# Altium project MD041A.PrjPcb (part 2 of 3)

## Sheet MD041_ezFET_RevA.SchDoc
size 431 x 279 mm; Date: Not shown in title block; ApprovedBy: Not shown in title block; CheckedBy: Not shown in title block; Author: Not shown in title block; CompanyName: Not shown in title block; Engineer: Not shown in title block; Organization: Not shown in title block; Address1: Not shown in title block; Address2: Not shown in title block; Address3: Not shown in title block; Address4: Not shown in title block; DocumentNumber: 2; Revision: Use project parameter SCH_Rev; SheetNumber: 2; SheetTotal: 4; PageSetup: Record=PageOptions|CenterHorizontal=True|CenterVertical=True|PrintScale=1.00|XCorrection=1.00|YCorrection=1.00|PrintKind=0|BorderSize=5000000|LeftOffset=0|BottomOffset=0|Orientation=2|PaperLength=1000|PaperWidth=1000|Scale=100|PaperSource=15|PrintQuality=600|MediaType=1|DitherType=10|PaperKind=Letter|PrintScaleMode=1; CurrentTime: Not shown in title block; CurrentDate: Not shown in title block; Time: Not shown in title block; DocumentFullPathAndName: Not shown in title block; DocumentName: Not shown in title block; ModifiedDate: Not shown in title block; ImagePath: Not shown in title block
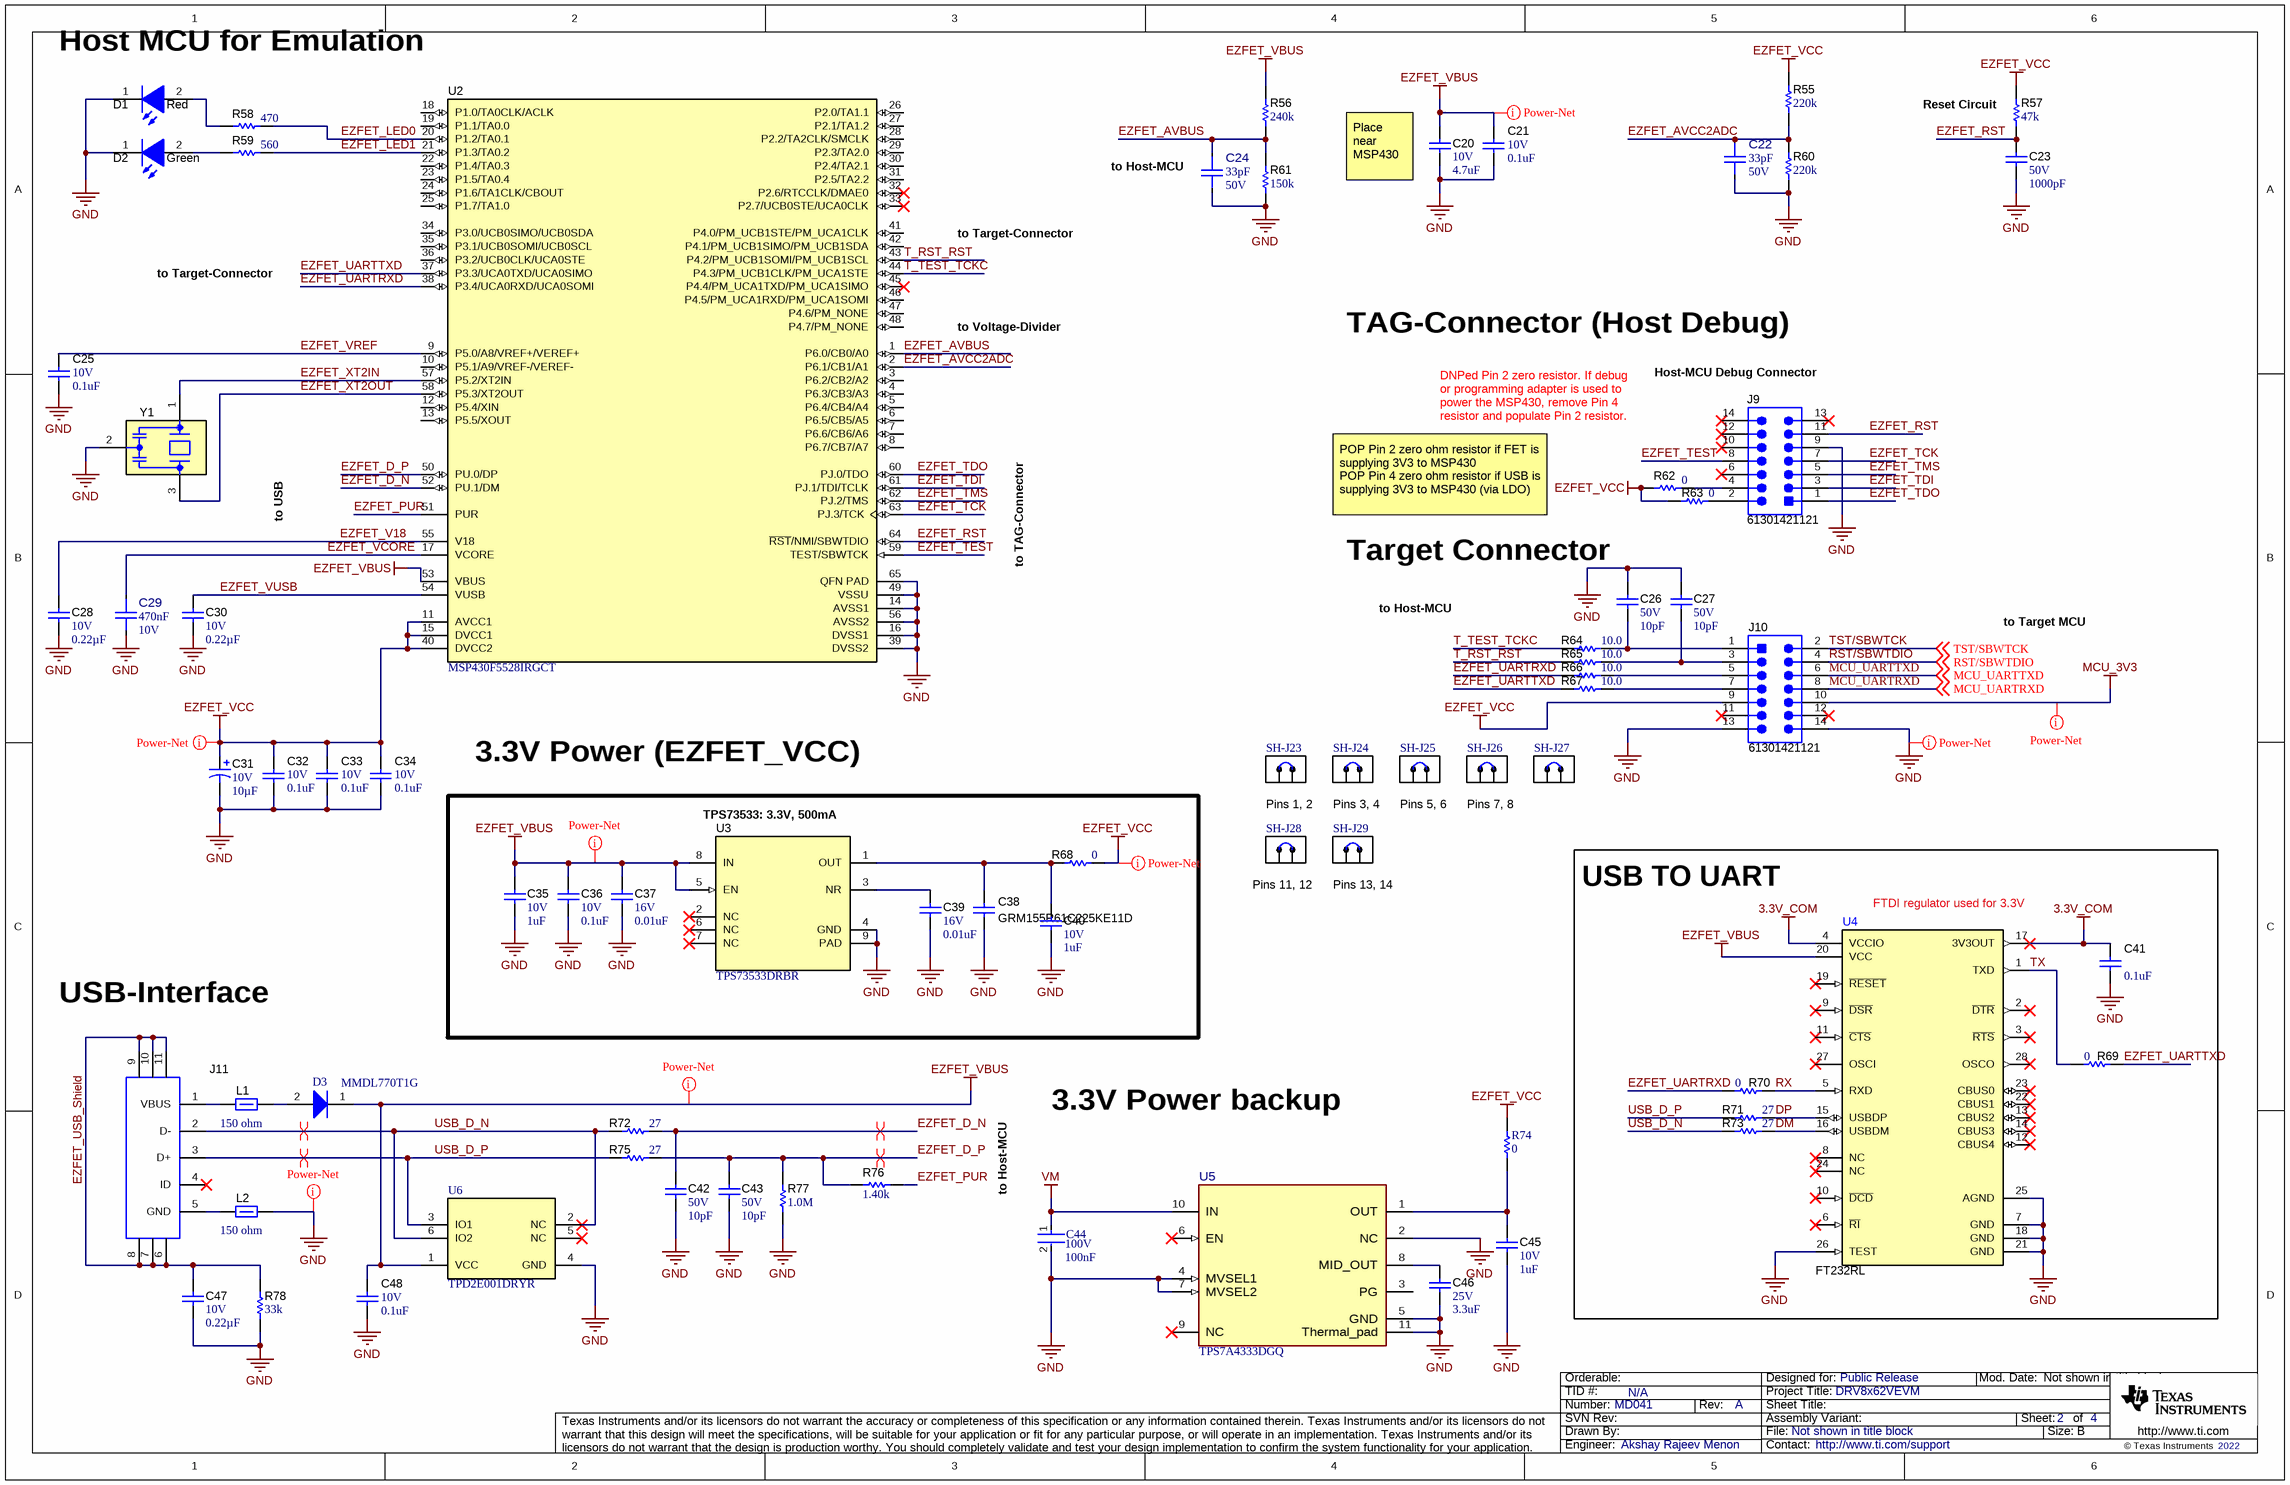
[diagram p1: MD041_ezFET_RevA.SchDoc]

### Parts
C20  VDC_V: 10V  ValueDisplayed: 4.7uF  [0402]  (hidden comment: C1005X5R1A475M050BC)
C21  VDC_V: 10V  ValueDisplayed: 0.1uF  [0402]  (hidden comment: 885012105010)
C22  ValueDisplayed: 33pF  VDC_V: 50V  [FP-885012005058_0402-MFG]  (hidden comment: 885012005058)
C23  VDC_V: 50V  ValueDisplayed: 1000pF  [0402]  (hidden comment: 885012205061)
C24  ValueDisplayed: 33pF  VDC_V: 50V  [FP-885012005058_0402-MFG]  (hidden comment: 885012005058)
C25  VDC_V: 10V  ValueDisplayed: 0.1uF  [0402]  (hidden comment: 885012105010)
C26  VDC_V: 50V  ValueDisplayed: 10pF  [0402]  (hidden comment: 885012005055)
C27  VDC_V: 50V  ValueDisplayed: 10pF  [0402]  (hidden comment: 885012005055)
C28  VDC_V: 10V  ValueDisplayed: 0.22µF  [0402]  (hidden comment: 885012105011)
C29  ValueDisplayed: 470nF  VDC_V: 10V  [FP-885012106008_0603-MFG]  (hidden comment: 885012106008)
C30  VDC_V: 10V  ValueDisplayed: 0.22µF  [0402]  (hidden comment: 885012105011)
C31  VDC_V: 10V  ValueDisplayed: 10µF  [3216-18]  (hidden comment: T520A106M010ATE080)
C32  VDC_V: 10V  ValueDisplayed: 0.1uF  [0402]  (hidden comment: 885012105010)
C33  VDC_V: 10V  ValueDisplayed: 0.1uF  [0402]  (hidden comment: 885012105010)
C34  VDC_V: 10V  ValueDisplayed: 0.1uF  [0402]  (hidden comment: 885012105010)
C35  VDC_V: 10V  ValueDisplayed: 1uF  [0402]  (hidden comment: 885012105012)
C36  VDC_V: 10V  ValueDisplayed: 0.1uF  [0402]  (hidden comment: GRM155R61A104KA01D)
C37  VDC_V: 16V  ValueDisplayed: 0.01uF  [0402]  (hidden comment: GRM155R71C103KA01D)
C38  GRM155R61C225KE11D  [0402]
C39  VDC_V: 16V  ValueDisplayed: 0.01uF  [0402]  (hidden comment: GRM155R71C103KA01D)
C40  VDC_V: 10V  ValueDisplayed: 1uF  [0402]  (hidden comment: 885012105012)
C41  ValueDisplayed: 0.1uF  [0402]  (hidden comment: 885012105010)
C42  VDC_V: 50V  ValueDisplayed: 10pF  [0402]  (hidden comment: 885012005055)
C43  VDC_V: 50V  ValueDisplayed: 10pF  [0402]  (hidden comment: 885012005055)
C44  Voltage Rating: 100V  Capacitance: 100nF  [FP-0603-L_1_6_0_1-W_0_8_0-IPC_B]  (hidden comment: HMK107BJ104MA-T)
C45  VDC_V: 10V  ValueDisplayed: 1uF  [0402]  (hidden comment: 885012105012)
C46  VDC_V: 25V  ValueDisplayed: 3.3uF  [0805_HV]  (hidden comment: GRM21BC81E335KA73L)
C47  VDC_V: 10V  ValueDisplayed: 0.22µF  [0402]  (hidden comment: 885012105011)
C48  VDC_V: 10V  ValueDisplayed: 0.1uF  [0402]  (hidden comment: 885012105010)
D1  value Red  [WL-SMCW_RED]  (hidden comment: 150060RS75000)
D2  value Green  [WL-SMCW_GREEN]  (hidden comment: 150060VS75000)
D3  MMDL770T1G  [ONSC-SOD-323-2-477-02_V]
J9  61301421121  [Wurth_61301421121]
J10  61301421121  [Wurth_61301421121]
J11  1051640001  [Molex_1051640001]  (value not drawn)
L1  value 150 ohm  [0603]  (hidden comment: BLM18AG151BH1D)
L2  ValueDisplayed: 150 ohm  [0603]  (hidden comment: BLM18AG151BH1D)
R55  ValueDisplayed: 220k  [0402]  (hidden comment: RC0402FR-07220KL)
R56  ValueDisplayed: 240k  [0402]  (hidden comment: CRCW0402240KFKED)
R57  ValueDisplayed: 47k  [0402]  (hidden comment: CRCW040247K0JNED)
R58  ValueDisplayed: 470  [0402]  (hidden comment: CRCW0402470RJNED)
R59  ValueDisplayed: 560  [0402]  (hidden comment: CRCW0402560RJNED)
R60  ValueDisplayed: 220k  [0402]  (hidden comment: RC0402FR-07220KL)
R61  ValueDisplayed: 150k  [0402]  (hidden comment: CRCW0402150KFKED)
R62  value 0  [0402L]  (hidden comment: ERJ-2GE0R00X)
R63  value 0  [0402L]  (hidden comment: ERJ-2GE0R00X)
R64  ValueDisplayed: 10.0  [0402]  (hidden comment: CRCW040210R0FKED)
R65  ValueDisplayed: 10.0  [0402]  (hidden comment: CRCW040210R0FKED)
R66  ValueDisplayed: 10.0  [0402]  (hidden comment: CRCW040210R0FKED)
R67  ValueDisplayed: 10.0  [0402]  (hidden comment: CRCW040210R0FKED)
R68  value 0  [0402L]  (hidden comment: Resistor)
R69  value 0  [0603L]  (hidden comment: Resistor)
R70  value 0  [0603L]  (hidden comment: Resistor)
R71  ValueDisplayed: 27  [0402]  (hidden comment: CRCW040227R0JNED)
R72  ValueDisplayed: 27  [0402]  (hidden comment: CRCW040227R0JNED)
R73  ValueDisplayed: 27  [0402]  (hidden comment: CRCW040227R0JNED)
R74  0  [RESC1005X40X25NL05T05]
R75  ValueDisplayed: 27  [0402]  (hidden comment: CRCW040227R0JNED)
R76  ValueDisplayed: 1.40k  [0402]  (hidden comment: CRCW04021K40FKED)
R77  ValueDisplayed: 1.0M  [0402]  (hidden comment: CRCW04021M00JNED)
R78  ValueDisplayed: 33k  [0402]  (hidden comment: CRCW040233K0JNED)
SH-J23  60900213421  [Wurth_60900213421]  (value not drawn)
SH-J24  60900213421  [Wurth_60900213421]  (value not drawn)
SH-J25  60900213421  [Wurth_60900213421]  (value not drawn)
SH-J26  60900213421  [Wurth_60900213421]  (value not drawn)
SH-J27  60900213421  [Wurth_60900213421]  (value not drawn)
SH-J28  60900213421  [Wurth_60900213421]  (value not drawn)
SH-J29  60900213421  [Wurth_60900213421]  (value not drawn)
U2  MSP430F5528IRGCT  [RGC0064B]
U3  TPS73533DRBR  [DRB0008A]
U4  FT232RL  [SSOP28_N]
U5  TPS7A4333DGQ  [DGQ0010E-MFG]
U6  TPD2E001DRYR  [DRY0006A]
Y1  CSTNR4M00GH5L000R0  [MuRata_CSTNR]  (value not drawn)

### Blocks framed on the sheet
TPS73533: 3.3V, 500mA: C35-C40 R68 U3
USB TO UART: C41 R69-R71 R73 U4

### Nets
3.3V_COM: C41.1 U4.4(VCCIO) U4.17(3V3OUT)
EZFET_VBUS: C20.1 C21.1 C35.1 C36.1 C37.1 C48.1 D3.1(K) R56.2 U2.53(VBUS) U3.5(EN) U3.8(IN) U4.20(VCC) U6.1(VCC)
EZFET_VCC: C31.1(+) C32.1 C33.1 C34.1 J10.9 R55.2 R57.2 R62.1 R63.1 R68.2 R74.2 U2.11(AVCC1) U2.15(DVCC1) U2.40(DVCC2)
GND: C20.2 C21.2 C22.2 C23.2 C24.2 C25.2 C26.1 C27.1 C28.2 C29.2 C30.2 C31.2(-) C32.2 C33.2 C34.2 C35.2 C36.2 C37.2 C38.2 C39.2 C40.2 C41.2 C42.2 C43.2 C44.2 C45.2 C46.2 C47.2 C48.2 D1.1(K) D2.1(K) J9.9 J10.13 J10.14 L2.2 R60.1 R61.1 R77.1 R78.1 U2.14(AVSS1) U2.16(DVSS1) U2.39(DVSS2) U2.49(VSSU) U2.56(AVSS2) U2.65(QFN_PAD) U3.4(GND) U3.9(PAD) U4.7(GND) U4.18(GND) U4.21(GND) U4.25(AGND) U4.26(TEST) U5.2(NC) U5.4(MVSEL1) U5.5(GND) U5.7(MVSEL2) U5.11(Thermal_pad) U6.4(GND) Y1.2(GND)
MCU_3V3: J10.10
VM: C44.1 U5.10(IN)
DM: R73.2 U4.16(USBDM)
DP: R71.2 U4.15(USBDP)
EZFET_AVBUS: C24.1 R56.1 R61.2 U2.1(P6.0/CB0/A0)
EZFET_AVCC2ADC: C22.1 R55.1 R60.2 U2.2(P6.1/CB1/A1)
EZFET_D_N: C42.1 R72.2 U2.52(PU.1/DM)
EZFET_D_P: C43.1 R75.2 R76.1 R77.2 U2.50(PU.0/DP)
EZFET_LED0: R58.2 U2.20(P1.2/TA0.1)
EZFET_LED1: R59.2 U2.21(P1.3/TA0.2)
EZFET_PUR: R76.2 U2.51(PUR)
EZFET_RST: C23.1 J9.11 R57.1 U2.64(~{RST}/NMI/SBWTDIO)
EZFET_TCK: J9.7 U2.63(PJ.3/TCK)
EZFET_TDI: J9.3 U2.61(PJ.1/TDI/TCLK)
EZFET_TDO: J9.1 U2.60(PJ.0/TDO)
EZFET_TEST: J9.8 U2.59(TEST/SBWTCK)
EZFET_TMS: J9.5 U2.62(PJ.2/TMS)
EZFET_UARTRXD: R66.1 R70.2 U2.38(P3.4/UCA0RXD/UCA0SOMI)
EZFET_UARTTXD: R67.1 R69.1 U2.37(P3.3/UCA0TXD/UCA0SIMO)
EZFET_USB_Shield: C47.1 J11.6 J11.7 J11.8 J11.9 J11.10 J11.11 R78.2
EZFET_V18: C28.1 U2.55(V18)
EZFET_VCORE: C29.1 U2.17(VCORE)
EZFET_VREF: C25.1 U2.9(P5.0/A8/VREF+/VEREF+)
EZFET_VUSB: C30.1 U2.54(VUSB)
EZFET_XT2IN: U2.57(P5.2/XT2IN) Y1.1(In)
EZFET_XT2OUT: U2.58(P5.3/XT2OUT) Y1.3(Out)
MCU_UARTRXD: J10.8 ; off-sheet MCU_UARTRXD
MCU_UARTTXD: J10.6 ; off-sheet MCU_UARTTXD
RST/SBWTDIO: J10.4 ; off-sheet RST/SBWTDIO
RX: R70.1 U4.5(RXD)
T_RST_RST: R65.1 U2.43(P4.2/PM_UCB1SOMI/PM_UCB1SCL)
T_TEST_TCKC: R64.1 U2.44(P4.3/PM_UCB1CLK/PM_UCA1STE)
TST/SBWTCK: J10.2 ; off-sheet TST/SBWTCK
TX: R69.2 U4.1(TXD)
USB_D_N: J11.2(D-) R72.1 R73.1 U6.2(NC) U6.6(IO2)
USB_D_P: J11.3(D+) R71.1 R75.1 U6.3(IO1)
NetC26_2: C26.2 J10.1 R64.2
NetC27_2: C27.2 J10.3 R65.2
NetC38_1: C38.1 C40.1 R68.1 U3.1(OUT)
NetC39_1: C39.1 U3.3(NR)
NetC45_1: C45.1 R74.1 U5.1(OUT)
NetC46_1: C46.1 U5.8(MID_OUT)
NetD1_2: D1.2(A) R58.1
NetD2_2: D2.2(A) R59.1
NetD3_2: D3.2(A) L1.2
NetJ9_2: J9.2 R63.2
NetJ9_4: J9.4 R62.2
NetJ10_5: J10.5 R66.2
NetJ10_7: J10.7 R67.2
NetJ11_1: J11.1(VBUS) L1.1
NetJ11_5: J11.5(GND) L2.1

Not connected (* = marked no-connect by the designer): J9 6* 10* 12* 13* 14*; J10 11* 12*; J11 4(ID)*; U2 3(P6.2/CB2/A2) 4(P6.3/CB3/A3) 5(P6.4/CB4/A4) 6(P6.5/CB5/A5) 7(P6.6/CB6/A6) 8(P6.7/CB7/A7) 10(P5.1/A9/VREF-/VEREF-) 12(P5.4/XIN) 13(P5.5/XOUT) 18(P1.0/TA0CLK/ACLK) 19(P1.1/TA0.0) 22(P1.4/TA0.3) 23(P1.5/TA0.4) 24(P1.6/TA1CLK/CBOUT) 25(P1.7/TA1.0) 26(P2.0/TA1.1) 27(P2.1/TA1.2) 28(P2.2/TA2CLK/SMCLK) 29(P2.3/TA2.0) 30(P2.4/TA2.1) 31(P2.5/TA2.2) 32(P2.6/RTCCLK/DMAE0)* 33(P2.7/UCB0STE/UCA0CLK)* 34(P3.0/UCB0SIMO/UCB0SDA) 35(P3.1/UCB0SOMI/UCB0SCL) 36(P3.2/UCB0CLK/UCA0STE) 41(P4.0/PM_UCB1STE/PM_UCA1CLK) 42(P4.1/PM_UCB1SIMO/PM_UCB1SDA) 45(P4.4/PM_UCA1TXD/PM_UCA1SIMO)* 46(P4.5/PM_UCA1RXD/PM_UCA1SOMI) 47(P4.6/PM_NONE) 48(P4.7/PM_NONE); U3 2(NC)* 6(NC)* 7(NC)*; U4 2(~{DTR})* 3(~{RTS})* 6(~{RI})* 8(NC)* 9(~{DSR})* 10(~{DCD})* 11(~{CTS})* 12(CBUS4)* 13(CBUS2)* 14(CBUS3)* 19(~{RESET})* 22(CBUS1)* 23(CBUS0)* 24(NC)* 27(OSCI)* 28(OSCO)*; U5 3(PG) 6(EN)* 9(NC)*; U6 5(NC)*

### Layout directives
net class Power-Net: EZFET_VBUS, EZFET_VCC, GND, MCU_3V3
differential pair: EZFET_D_N, EZFET_D_P, USB_D_N, USB_D_P

### Notes on the sheet
- (near D1) Host MCU for Emulation
- (near C24) to Host-MCU
- (near R57) Reset Circuit
- to Target-Connector
- (near C20) Place near MSP430
- to Voltage-Divider
- TAG-Connector (Host Debug)
- DNPed Pin 2 zero resistor. If debug or programming adapter is used to power the MSP430, remove Pin 4 resistor and populate Pin 2 resistor.
- (near J9) Host-MCU Debug Connector
- to USB
- to TAG-Connector
- POP Pin 2 zero ohm resistor if FET is supplying 3V3 to MSP430
  POP Pin 4 zero ohm resistor if USB is supplying 3V3 to MSP430 (via LDO)
- Target Connector
- to Host-MCU
- to Target MCU
- 3.3V Power (EZFET_VCC)
- Pins 1, 2
- Pins 3, 4
- (near SH-J25) Pins 5, 6
- (near SH-J26) Pins 7, 8
- (near SH-J28) Pins 11, 12
- (near SH-J29) Pins 13, 14
- (near U4) FTDI regulator used for 3.3V
- USB-Interface
- 3.3V Power backup
- Drawn By:
- SVN Rev:
- Number:
- TID #:
- Orderable:
- Rev:
- Sheet Title:
- File:
- Project Title:
- Designed for:
- Assembly Variant:
- Mod. Date:
- Sheet:
- Size:
- of
- B
- http://www.ti.com
- Texas Instruments and/or its licensors do not warrant the accuracy or completeness of this specification or any information contained therein. Texas Instruments and/or its licensors do not warrant that this design will meet the specifications, will be suitable for your application or fit for any particular purpose, or will operate in an implementation. Texas Instruments and/or its licensors do not warrant that the design is production worthy. You should completely validate and test your design implementation to confirm the system functionality for your application.
- Engineer:
- Contact:
- © Texas Instruments

### Library data of the parts
C20 = CMP-0006269-2: CAP, CERM, 4.7 uF, 10 V, +/- 20%, X5R, 0402; Manufacturer: TDK; TaMin_C: -55°C; Polarized: N; SizeAreaWB_mm2: 3; Value1: Unknown; U/M: EA; Value: 4.7uF; TaMax_C: 85°C; SizeZ_mm: 0.6; SizeX_mm: 1; SizeY_mm: 0.5; Cap_F: 4.7µF; AEC Category: Q200; ComponentLink1URL: http://product.tdk.com/en/catalog/datasheets/mlcc_commercial_general_en.pdf; Supplier Part Number 2: 04X3214; Publisher: Texas Instruments; Supplier 2: Newark; Supplier Part Number 3: 810-C1005X5R1A475M; TempCo: X5R; Supplier 3: Mouser; Published: 2008-06-19; RoHS: Y; MountType: SMT; Supplier 1: Digi-Key; PackageReference: 0402; Tolerance_%: 20%; Cap_Case: 0402; Value2: 10V; SizeArea_mm2: 0.5; CompType: Capacitor; LatestRevisionDate: 2017-03-09; PartNumber: C1005X5R1A475M050BC; AEC Qualified: N; ComponentLink1Description: Datasheet link; AEC Grade: N/A; Supplier Part Number 1: 445-8023-1-ND; Technology: Ceramic
C21 C25 C32-C34 C48 = CMP-0006221-2: CAP, CERM, 0.1 uF, 10 V, +/- 20%, X5R, 0402; Manufacturer: Wurth Elektronik; TaMin_C: -55°C; Polarized: N; SizeAreaWB_mm2: 3; Value1: Unknown; U/M: EA; Value: 0.1uF; TaMax_C: 85°C; SizeZ_mm: 0.6; SizeX_mm: 1; SizeY_mm: 0.5; Cap_F: 100nF; AEC Category: Q200; Supplier Part Number 2: 710-885012105010; Publisher: Texas Instruments; Supplier 2: Mouser; TempCo: X5R; Published: 2008-06-19; RoHS: Y; MountType: SMT; Supplier 1: Digi-Key; PackageReference: 0402; Tolerance_%: 20%; Cap_Case: 0402; Value2: 10V; SizeArea_mm2: 0.5; CompType: Capacitor; LatestRevisionDate: 2017-03-09; PartNumber: 885012105010; AEC Qualified: N; ComponentLink1Description: Datasheet link; AEC Grade: N/A; Supplier Part Number 1: 732-7487-1-ND; Technology: Ceramic; ComponentLink1URL: http://katalog.we-online.de/pbs/datasheet/885012105010.pdf
C22 C24 = CMP-0097306-1: 33 pF ±5% 50V Ceramic Capacitor C0G, NP0 0402 (1005 Metric); Manufacturer: Wurth Electronics; AEC Qualified: No; Value: 33pF; TempCo: 30ppm/°C; SizeZ_mm: 0.55mm; Temperature Characteristic: NP0; Datasheet Path: datasheets/Cap-885012005058.pdf; Supplier 2: Mouser; Tolerance_%: 5%; Operating Temperature Range: -55°C to +125°C; PackageReference: 0402; Part Number: 885012005058; Digikey Part Number: 732-7472-1-ND; Cap_F: 33pF; Mouser Part Number: 710-885012005058; Supplier Part Number 1: 732-7472-1-ND; Lead Free: Yes; datasheet: https://www.we-online.com/catalog/datasheet/885012005058.pdf; helpURL: https://upverter.com/upn/revision/4d12e9af320262d8/; ComponentLink1Description: Datasheet; Supplier 1: Digikey; ComponentLink1URL: https://www.we-online.com/catalog/datasheet/885012005058.pdf; Supplier Part Number 2: 710-885012005058; RoHS: TRUE; PartNumber: 885012005058; Digikey Description: CAP CER 33PF 50V C0G/NP0 0402
C23 = CMP-0006231-2: CAP, CERM, 1000 pF, 50 V, +/- 10%, X7R, 0402; Manufacturer: Wurth Elektronik; TaMin_C: -55°C; Polarized: N; SizeAreaWB_mm2: 3; Value1: Unknown; U/M: EA; Value: 1000pF; TaMax_C: 125°C; SizeZ_mm: 0.6; SizeX_mm: 1; SizeY_mm: 0.5; Cap_F: 1nF; AEC Category: Q200; Supplier Part Number 2: 710-885012205061; Publisher: Texas Instruments; Supplier 2: Mouser; TempCo: X7R; Published: 2008-06-19; RoHS: Y; MountType: SMT; Supplier 1: Digi-Key; PackageReference: 0402; Tolerance_%: 10%; Cap_Case: 0402; Value2: 50V; SizeArea_mm2: 0.5; CompType: Capacitor; LatestRevisionDate: 2017-03-09; PartNumber: 885012205061; AEC Qualified: N; ComponentLink1Description: Datasheet link; AEC Grade: N/A; Supplier Part Number 1: 732-7556-1-ND; Technology: Ceramic; ComponentLink1URL: http://katalog.we-online.de/pbs/datasheet/885012205061.pdf
C26 C27 C42 C43 = CMP-0006215-2: CAP, CERM, 10 pF, 50 V, +/- 5%, C0G/NP0, 0402; Manufacturer: Wurth Elektronik; TaMin_C: -55°C; Polarized: N; SizeAreaWB_mm2: 3; Value1: Unknown; U/M: EA; Value: 10pF; TaMax_C: 125°C; SizeZ_mm: 0.6; SizeX_mm: 1; SizeY_mm: 0.5; AEC Category: Q200; Supplier Part Number 2: 710-885012005055; Publisher: Texas Instruments; Supplier 2: Mouser; TempCo: C0G/NP0; Published: 2008-06-19; RoHS: Y; MountType: SMT; Supplier 1: Digi-Key; PackageReference: 0402; Tolerance_%: 5%; Cap_Case: 0402; Value2: 50V; SizeArea_mm2: 0.5; CompType: Capacitor; LatestRevisionDate: 2017-03-09; PartNumber: 885012005055; AEC Qualified: N; Cap_F: 10pF; ComponentLink1Description: Datasheet link; AEC Grade: N/A; Supplier Part Number 1: 732-7469-1-ND; Technology: Ceramic; ComponentLink1URL: http://katalog.we-online.de/pbs/datasheet/885012005055.pdf
C28 C30 C47 = CMP-0078875-1: CAP, CERM, 0.22 µF, 10 V,+/- 20%, X5R, 0402; Manufacturer: Wurth Elektronik; TaMin_C: -55°C; Polarized: N; SizeAreaWB_mm2: 3; U/M: EA; Value: 0.22uF; TaMax_C: 85°C; SizeZ_mm: 0.6; SizeX_mm: 1; SizeY_mm: 0.5; Cap_F: 220nF; AEC Category: Q200; ComponentLink1URL: http://katalog.we-online.de/pbs/datasheet/885012105011.pdf; Supplier Part Number 2: 710-885012105011; Supplier 2: Mouser; TempCo: X5R; RoHS: Y; MountType: SMT; Supplier 1: Digi-Key; PackageReference: 0402; Tolerance_%: 20%; Cap_Case: 0402; Value2: 10V; SizeArea_mm2: 0.5; CompType: Capacitor; PartNumber: 885012105011; AEC Qualified: N; ComponentLink1Description: Datasheet link; AEC Grade: N/A; Supplier Part Number 1: 732-7488-1-ND; Technology: Ceramic
C29 = CMP-0097299-1: 0.47 µF ±20% 10V Ceramic Capacitor X5R 0603 (1608 Metric); Manufacturer: Wurth Electronics; Value: 470nF; AEC Qualified: No; TempCo: 15%; SizeZ_mm: 0.87mm; RoHS: TRUE; Mouser Description: Cap, Mlcc, X5r, 0.47Uf, 10V, 0603; Tolerance_%: 20%; Part Number: 885012106008; Supplier 1: Digikey; Lead Free: Yes; datasheet: https://www.we-online.com/catalog/datasheet/885012106008.pdf; Supplier 2: Mouser; ComponentLink1Description: Datasheet; ComponentLink1URL: https://www.we-online.com/catalog/datasheet/885012106008.pdf; Supplier Part Number 1: 732-7905-1-ND; PartNumber: 885012106008; Cap_F: 470nF; Operating Temperature Range: -55°C to +85°C; Temperature Characteristic: X5R; PackageReference: 0603; Digikey Part Number: 732-7905-1-ND; Digikey Description: CAP CER 0.47UF 10V X5R 0603; Mouser Part Number: 710-885012106008; Datasheet Path: datasheets/Cap-885012106008.pdf; helpURL: https://upverter.com/upn/revision/0b4a8a67df2e586c/; Supplier Part Number 2: 710-885012106008
C31 = CMP-0084376-1: CAP, Tantalum Polymer, 10 µF, 10 V,+/- 20%, 0.08 ohm, 3216-18 SMD; Manufacturer: Kemet; TaMin_C: -55°C; SizeArea_mm2: 5.12; Value: 10uF; SizeAreaWB_mm2: 10.92; SizeY_mm: 1.6; Polarized: Y; SizeX_mm: 3.2; AEC Qualified: N; TaMax_C: 105°C; SizeZ_mm: 1.8; ESR_ohm: 80m; CompType: Capacitor; AEC Category: Q200; PackageReference: 3216-18; Technology: Tantalum Polymer; Cap_Case: 3216-18; ComponentLink1URL: https://content.kemet.com/datasheets/KEM_T2076_T52X-530.pdf; ComponentLink1Description: Datasheet link; PartNumber: T520A106M010ATE080; Value1: 0.08 ohm; MountType: SMT; Value2: 10V; Cap_F: 10µF; RoHS: Y; Series: T520; Tolerance_%: 20%; AEC Grade: N/A
C35 C40 C45 = CMP-0064924-2: CAP, CERM, 1 uF, 10 V,+/- 20%, X5R, 0402; Manufacturer: Wurth Elektronik; TaMin_C: -55°C; Polarized: N; SizeAreaWB_mm2: 3; Value1: Unknown; U/M: EA; Value: 1uF; TaMax_C: 85°C; SizeZ_mm: 0.6; SizeX_mm: 1; SizeY_mm: 0.5; Cap_F: 1µF; AEC Category: Q200; ComponentLink1URL: http://katalog.we-online.de/pbs/datasheet/885012105012.pdf; Supplier Part Number 2: 75Y5997; Publisher: Texas Instruments; Supplier 2: Newark; Supplier Part Number 3: 710-885012105012; TempCo: X5R; Supplier 3: Mouser; Published: 2008-06-19; RoHS: Y; MountType: SMT; Supplier 1: Digi-Key; PackageReference: 0402; Tolerance_%: 20%; Cap_Case: 0402; Value2: 10V; SizeArea_mm2: 0.5; CompType: Capacitor; LatestRevisionDate: 2017-06-05; PartNumber: 885012105012; AEC Qualified: N; ComponentLink1Description: Datasheet link; AEC Grade: N/A; Supplier Part Number 1: 732-7489-1-ND; Technology: Ceramic
C36 = CMP-0006562-2: CAP, CERM, 0.1 uF, 10 V, +/- 10%, X5R, 0402; Manufacturer: MuRata; TaMin_C: -55°C; Polarized: N; SizeAreaWB_mm2: 3; Value1: Unknown; U/M: EA; Value: 0.1uF; TaMax_C: 85°C; SizeZ_mm: 0.6; SizeX_mm: 1; SizeY_mm: 0.5; Cap_F: 100nF; AEC Category: Q200; ComponentLink1URL: http://search.murata.co.jp/Ceramy/PnsearchViewAction.do?HnOFG=ON&HnNFG=ON&SEL_CNT=50&sLang=en&sKey=GRM155R61A104KA01D&x=9&y=9&search=startwith; Supplier Part Number 2: 81-GRM155R61A104KA01; Publisher: Texas Instruments; Supplier 2: Mouser; Supplier Part Number 3: 1828862; TempCo: X5R; Supplier 3: Farnell; Published: 2008-06-19; RoHS: Y; MountType: SMT; Supplier 1: Digi-Key; PackageReference: 0402; Tolerance_%: 10%; Cap_Case: 0402; Value2: 10V; SizeArea_mm2: 0.5; CompType: Capacitor; LatestRevisionDate: 2017-03-09; PartNumber: GRM155R61A104KA01D; AEC Qualified: ?; ComponentLink1Description: Datasheet link; Supplier Part Number 1: 490-1318-1-ND; Technology: Ceramic
C37 C39 = CMP-0006639-2: CAP, CERM, 0.01 uF, 16 V, +/- 10%, X7R, 0402; Manufacturer: MuRata; TaMin_C: -55°C; Polarized: N; SizeAreaWB_mm2: 3; Value1: Unknown; U/M: EA; Value: 0.01uF; TaMax_C: 125°C; SizeZ_mm: 0.6; SizeX_mm: 1; SizeY_mm: 0.5; Cap_F: 10nF; AEC Category: Q200; ComponentLink1URL: http://search.murata.co.jp/Ceramy/PnsearchViewAction.do?HnOFG=ON&HnNFG=ON&SEL_CNT=50&sLang=en&sKey=GRM155R71C103KA01D&x=9&y=9&search=startwith; Supplier Part Number 2: 14T3279; Publisher: Texas Instruments; Supplier 2: Newark; Supplier Part Number 3: 81-GRM36X103K16; TempCo: X7R; Supplier 3: Mouser; Published: 2008-06-19; RoHS: Y; MountType: SMT; Supplier 1: Digi-Key; PackageReference: 0402; Tolerance_%: 10%; Cap_Case: 0402; Value2: 16V; SizeArea_mm2: 0.5; CompType: Capacitor; LatestRevisionDate: 2017-03-09; PartNumber: GRM155R71C103KA01D; AEC Qualified: ?; ComponentLink1Description: Datasheet link; Supplier Part Number 1: 490-1313-1-ND; Technology: Ceramic
C38 = CMP-0006594-2: CAP, CERM, 2.2 uF, 16 V, +/- 10%, X5R, 0402; Manufacturer: MuRata; TaMin_C: -55°C; Polarized: N; SizeAreaWB_mm2: 3; Value1: Unknown; U/M: EA; Value: 2.2uF; TaMax_C: 85°C; SizeZ_mm: 0.6; SizeX_mm: 1; SizeY_mm: 0.5; Value2: 16V; Cap_F: 2.2µF; AEC Category: Q200; Supplier Part Number 2: 81-GRM155R61C225KE1D; Publisher: Texas Instruments; Supplier 2: Mouser; TempCo: X5R; Published: 2008-06-19; RoHS: Y; MountType: SMT; Supplier 1: Digi-Key; PackageReference: 0402; Tolerance_%: 10%; Cap_Case: 0402; SizeArea_mm2: 0.5; CompType: Capacitor; LatestRevisionDate: 2017-03-09; PartNumber: GRM155R61C225KE11D; AEC Qualified: N; VDC_V: 16V; ComponentLink1Description: Datasheet link; AEC Grade: N/A; Supplier Part Number 1: 490-10695-1-ND; Technology: Ceramic; ValueDisplayed: 2.2uF; ComponentLink1URL: http://psearch.en.murata.com/capacitor/product/GRM155R61C225KE11%23.pdf
C41 = CMP-0006221-2: CAP, CERM, 0.1 uF, 10 V, +/- 20%, X5R, 0402; Manufacturer: Wurth Elektronik; Value: 0.1uF; Polarized: N; U/M: EA; Cap_F: 100nF; Value1: Unknown; VDC_V: 10V; TaMin_C: -55°C; TaMax_C: 85°C; AEC Category: Q200; SizeArea_mm2: 0.5; SizeAreaWB_mm2: 3; SizeX_mm: 1; SizeZ_mm: 0.6; CompType: Capacitor; PartNumber: 885012105010; PackageReference: 0402; RoHS: Y; Tolerance_%: 20%; Value2: 10V; MountType: SMT; Technology: Ceramic; TempCo: X5R; Cap_Case: 0402; Published: 2008-06-19; Publisher: Texas Instruments; LatestRevisionDate: 2017-03-09; ComponentLink1Description: Datasheet link; ComponentLink1URL: http://katalog.we-online.de/pbs/datasheet/885012105010.pdf; Supplier 1: Digi-Key; Supplier Part Number 1: 732-7487-1-ND; Supplier 2: Mouser; Supplier Part Number 2: 710-885012105010; AEC Grade: N/A; AEC Qualified: N; SizeY_mm: 0.5
C44 = CMP-14477-003474-2: None; Dielectric: X5R; Tolerance: 20%; Mount: Surface Mount; Radiation Hardening: No; Max Operating Temperature: 85°C; RoHS Compliant: Yes; Depth: 0.8mm; Halogen Free: Halogen Free; Case/Package: Ceramic; Thickness: 0.035inch; Width: 0.031inch; Lead Free: Lead Free; Packaging: Tape and Reel; Min Operating Temperature: -55°C; Voltage Rating (DC): 100V; Length: 1.6mm
C46 = CMP-0008271-1: CAP, CERM, 3.3 uF, 25 V, +/- 10%, X6S, 0805; Manufacturer: MuRata; TaMin_C: -55°C; Polarized: N; SizeAreaWB_mm2: 6.75; Value1: Unknown; U/M: EA; Value: 3.3uF; TaMax_C: 105°C; SizeZ_mm: 1.45; SizeX_mm: 2; SizeY_mm: 1.25; Cap_Case: 0805; SizeArea_mm2: 2.5; Cap_F: 3.3µF; AEC Category: Q200; ComponentLink1URL: http://search.murata.co.jp/Ceramy/PnsearchViewAction.do?HnOFG=ON&HnNFG=ON&SEL_CNT=50&sLang=en&sKey=GRM21BC81E335KA73L&x=9&y=9&search=startwith; Supplier Part Number 2: 81-GRM21BC81E335KA3L; Publisher: Texas Instruments; Supplier 2: Mouser; TempCo: X6S; Published: 2008-06-19; RoHS: Y; MountType: SMT; Supplier 1: Digi-Key; PackageReference: 0805; Tolerance_%: 10%; Value2: 25V; CompType: Capacitor; LatestRevisionDate: 2017-03-09; PartNumber: GRM21BC81E335KA73L; AEC Qualified: ?; ComponentLink1Description: Datasheet link; Supplier Part Number 1: GRM21BC81E335KA73L-ND; Technology: Ceramic
D1 = CMP-0002947-3: LED, Red, SMD; Manufacturer: Wurth Elektronik; Type: AlInGaP; Vf_V: 2V; Io_A: 30mA; Vr_V: 5V; Tjmax_C: 85°C; Power_TotalModule: 72mW; Value1: 0.072W; Angle: 140; CompType: LED; PartNumber: 150060RS75000; MountType: SMT; RoHS: Y; PackageReference: LED_0603; Value2: 2V; Color: Red; ComponentLink1URL: http://katalog.we-online.de/led/datasheet/150060RS75000.pdf; ComponentLink1Description: Datasheet link
D2 = CMP-0002894-2: LED, Green, SMD; Manufacturer: Wurth Elektronik; Type: AlInGaP; Vf_V: 2V; Io_A: 20mA; Value1: W; CompType: LED; PartNumber: 150060VS75000; MountType: SMT; RoHS: Y; PackageReference: LED_0603; Value2: 2V; Color: green; ComponentLink1URL: http://katalog.we-online.de/led/datasheet/150060VS75000.pdf; ComponentLink1Description: Datasheet link
D3 = CMP-1055-00457-1: Schottky Barrier Diode, 2-Pin SOD-323, Pb-Free, Tape and Reel; Manufacturer: On Semiconductor; Configuration: Single; ComponentLink2URL: http://www.onsemi.cn/pub_link/Collateral/MMDL770T1-D.PDF; DatasheetVersion: Rev. 3; PartNumber: MMDL770T1G; ComponentLink3Description: Package Specification; ComponentLink2Description: Datasheet; Mounting Technology: Surface Mount; ComponentLink1Description: Manufacturer URL; PackageDescription: 2-Pin SOD, Body 1.7 x 1.25 mm; ComponentLink3URL: http://www.onsemi.com/pub_link/Collateral/477-02.PDF.1; PackageReference: SOD-323-2-477-02; ComponentLink1URL: http://www.onsemi.com/; RoHS: TRUE; Packing: Tape and Reel; PackageVersion: Rev. H, 03/2007
J9 J10 = CMP-0086014-1: Header, 2.54mm, 7x2, Gold, TH; Manufacturer: Wurth Elektronik; Pitch_mm: 2.54; Voltage_V: 250V; Shrouded: N; Gender: Male; Current_A: 3A; Cert_UL: Y; Row_Count: 2; CompType: Header; Color: Black; PackageReference: Header, 2.54mm, 7x2, TH; PinCount: 14; Orientation: Vertical; RoHS: Y; RowSpacing_mm: 2.54; ComponentLink1URL: https://katalog.we-online.de/em/datasheet/6130xx21121.pdf; ClassName: Header; ContactFinish: Gold; MountType: TH; ComponentLink1Description: Datasheet URL; PartNumber: 61301421121
J11 = CMP-0055311-1: Receptacle, USB 2.0, Micro B, 5 Position, R/A, SMT; Manufacturer: Molex; Pitch_mm: 0.65; Gender: Female; ContactFinish: Gold; Current_A: 1.8A; Voltage_V: 30V; Cert_UL: Y; CNHeader: FALSE; CT: TRUE; PartNumber: 1051640001; PackageReference: Receptacle, USB 2.0, Micro B, 5 Pos, 0.65mm Pitch, R/A, SMT; CompType: USB; RoHS: Y; MountType: SMT; ComponentLink1Description: Datasheet URL; ComponentLink1URL: http://www.molex.com/pdm_docs/sd/1051640001_sd.pdf; Orientation: R/A; PinCount: 5; Color: Black; Publisher: Texas Instruments; LatestRevisionDate: 26/05/2017; Supplier 1: Digi-Key; Supplier Part Number 1: WM11263CT-ND; Supplier 2: Newark; Supplier Part Number 2: 99Y3224; Supplier 3: Mouser; Supplier Part Number 3: 538-105164-0001
L1 = CMP-0081962-1: Ferrite Bead, 150 ohm @ 100 MHz, 0.7 A, 0603; Manufacturer: MuRata; SizeAreaWB_mm2: 4.68; SizeArea_mm2: 1.28; SizeZ_mm: 1; Imax_A: 700mA; ZTyp@100MHz_Ohm: 150; SizeY_mm: 0.8; Value2: 0.7A; Value1: 0.35 ohm; DCR_ohm: 0.35; SizeX_mm: 1.6; ComponentLink1Description: Datasheet link; RoHS: Y; Supplier 1: Digi-Key; PackageReference: 0603; PartNumber: BLM18AG151BH1D; Supplier Part Number 2: 81-BLM18AG151BH1D; Supplier 2: Mouser; ComponentLink1URL: http://www.murata.com/en-us/products/productdata/8798137286686/QNFA9129.pdf; CompType: Ferrite Bead; MountType: SMT; Supplier Part Number 1: 490-14035-1-ND; ValueDisplayed: 150 ohm
L2 = CMP-0081962-1: Ferrite Bead, 150 ohm @ 100 MHz, 0.7 A, 0603; Manufacturer: MuRata; SizeAreaWB_mm2: 4.68; SizeArea_mm2: 1.28; Value: 150 ohm; SizeZ_mm: 1; Imax_A: 700mA; ZTyp@100MHz_Ohm: 150; SizeY_mm: 0.8; Value2: 0.7A; Value1: 0.35 ohm; DCR_ohm: 0.35; SizeX_mm: 1.6; ComponentLink1Description: Datasheet link; RoHS: Y; Supplier 1: Digi-Key; PackageReference: 0603; PartNumber: BLM18AG151BH1D; Supplier Part Number 2: 81-BLM18AG151BH1D; Supplier 2: Mouser; ComponentLink1URL: http://www.murata.com/en-us/products/productdata/8798137286686/QNFA9129.pdf; CompType: Ferrite Bead; MountType: SMT; Supplier Part Number 1: 490-14035-1-ND
R55 R60 = CMP-0026728-1: RES, 220 k, 1%, 0.0625 W, 0402; Manufacturer: Yageo America; Power_W: 62.5mW; TempCo: 100 ppm/C; U/M: EA; Value: 220k; SizeX_mm: 1; SizeY_mm: 0.5; SizeZ_mm: 0.6; AEC Qualified: N; VDC_V: 50V; AEC Category: Q200; ComponentLink1URL: http://www.yageo.com/documents/recent/PYu-RC0402_51_RoHS_L_6_r.pdf; Supplier Part Number 2: 98K7527; Publisher: Texas Instruments; Supplier 2: Newark; Supplier Part Number 3: 603-RC0402FR-07220KL; Supplier 3: Mouser; Published: 2008-06-26; Value_Code: 220k; RoHS: Y; Value1: 1%; MountType: SMT; Supplier 1: Digi-Key; PackageReference: 0402; Tolerance_%: 1%; Res_ohm: 220k; Value2: 0.0625W; SizeArea_mm2: 0.5; CompType: Resistor; LatestRevisionDate: 2017-03-09; PartNumber: RC0402FR-07220KL; ComponentLink1Description: Datasheet link; AEC Grade: N/A; Supplier Part Number 1: 311-220KLRCT-ND; Technology: Thick Film
R56 = CMP-0026190-2: RES, 240 k, 1%, 0.063 W, AEC-Q200 Grade 0, 0402; Manufacturer: Vishay-Dale; Power_W: 63mW; TempCo: 100 ppm/C; Value: 240k; SizeX_mm: 1; SizeY_mm: 0.5; SizeZ_mm: 0.6; Value2: 0.063W; AEC Qualified: Y; VDC_V: 50V; AEC Category: Q200; AEC Grade: 0; ComponentLink1URL: http://www.vishay.com/docs/20035/dcrcwe3.pdf; Supplier Part Number 2: 51P0040; Supplier 2: Newark; Supplier Part Number 3: 71-CRCW0402240KFKED; Supplier 3: Mouser; Value_Code: 240k; RoHS: E; Value1: 1%; MountType: SMT; Supplier 1: Digi-Key; PackageReference: 0402; Tolerance_%: 1%; Res_ohm: 240k; SizeArea_mm2: 0.5; CompType: Resistor; PartNumber: CRCW0402240KFKED; ComponentLink1Description: Datasheet link; Supplier Part Number 1: 541-240KLCT-ND; Technology: Thick Film
R57 = CMP-0026935-3: RES, 47 k, 5%, 0.063 W, AEC-Q200 Grade 0, 0402; Manufacturer: Vishay-Dale; Power_W: 63mW; TempCo: 200 ppm/C; Value_Code: 47k0; Value: 47k; EIA_Code: E24; SizeX_mm: 1; SizeY_mm: 0.5; SizeZ_mm: 0.6; Value2: 0.063W; AEC Qualified: Y; VDC_V: 50V; AEC Category: Q200; AEC Grade: 0; Supplier Part Number 2: 52K7099; Supplier 2: Newark; Supplier Part Number 3: 71-CRCW0402-J-47K-E3; Supplier 3: Mouser; RoHS: E; Value1: 5%; MountType: SMT; Supplier 1: Digi-Key; PackageReference: 0402; Tolerance_%: 5%; Res_ohm: 47k; SizeArea_mm2: 0.5; CompType: Resistor; PartNumber: CRCW040247K0JNED; ComponentLink1Description: Datasheet link; Supplier Part Number 1: 541-47KJCT-ND; Technology: Thick Film; ComponentLink1URL: http://www.vishay.com/docs/20035/dcrcwe3.pdf
R58 = CMP-0026934-3: RES, 470, 5%, 0.063 W, AEC-Q200 Grade 0, 0402; Manufacturer: Vishay-Dale; Value: 470; Value_Code: 470R; Power_W: 63mW; Value2: 0.063W; VDC_V: 50V; TempCo: 200 ppm/C; SizeArea_mm2: 0.5; SizeX_mm: 1; SizeZ_mm: 0.6; EIA_Code: E24; AEC Category: Q200; AEC Qualified: Y; AEC Grade: 0; CompType: Resistor; PartNumber: CRCW0402470RJNED; PackageReference: 0402; RoHS: E; Res_ohm: 470; Tolerance_%: 5%; Value1: 5%; MountType: SMT; Technology: Thick Film; SizeY_mm: 0.5; ComponentLink1Description: Datasheet link; ComponentLink1URL: http://www.vishay.com/docs/20035/dcrcwe3.pdf; Supplier 1: Digi-Key; Supplier Part Number 1: 541-470JCT-ND; Supplier 2: Newark; Supplier Part Number 2: 59M6737; Supplier 3: Mouser; Supplier Part Number 3: 71-CRCW0402J-470-E3
R59 = CMP-0026948-3: RES, 560, 5%, 0.063 W, AEC-Q200 Grade 0, 0402; Manufacturer: Vishay-Dale; Power_W: 63mW; TempCo: 200 ppm/C; Value_Code: 560R; Value: 560; EIA_Code: E24; SizeX_mm: 1; SizeY_mm: 0.5; SizeZ_mm: 0.6; Value2: 0.063W; AEC Qualified: Y; VDC_V: 50V; AEC Category: Q200; AEC Grade: 0; Supplier Part Number 2: 59M6740; Supplier 2: Newark; Supplier Part Number 3: 71-CRCW0402J-560-E3; Supplier 3: Mouser; RoHS: E; Value1: 5%; MountType: SMT; Supplier 1: Digi-Key; PackageReference: 0402; Tolerance_%: 5%; Res_ohm: 560; SizeArea_mm2: 0.5; CompType: Resistor; PartNumber: CRCW0402560RJNED; ComponentLink1Description: Datasheet link; Supplier Part Number 1: 541-560JCT-ND; Technology: Thick Film; ComponentLink1URL: http://www.vishay.com/docs/20035/dcrcwe3.pdf
R61 = CMP-0026021-3: RES, 150 k, 1%, 0.063 W, AEC-Q200 Grade 0, 0402; Manufacturer: Vishay-Dale; Power_W: 63mW; TempCo: 100 ppm/C; Value: 150k; EIA_Code: E96; SizeX_mm: 1; SizeY_mm: 0.5; SizeZ_mm: 0.6; Value2: 0.063W; AEC Qualified: Y; VDC_V: 50V; AEC Category: Q200; AEC Grade: 0; ComponentLink1URL: http://www.vishay.com/docs/20035/dcrcwe3.pdf; Supplier Part Number 2: 52K6719; Supplier 2: Newark; Supplier Part Number 3: 71-CRCW0402-150K-E3; Supplier 3: Mouser; Value_Code: 150k; RoHS: E; Value1: 1%; MountType: SMT; Supplier 1: Digi-Key; PackageReference: 0402; Tolerance_%: 1%; Res_ohm: 150k; SizeArea_mm2: 0.5; CompType: Resistor; PartNumber: CRCW0402150KFKED; ComponentLink1Description: Datasheet link; Supplier Part Number 1: 541-150KLCT-ND; Technology: Thick Film
R62 R63 = CMP-0026992-3: RES, 0, 5%, 0.1 W, AEC-Q200 Grade 0, 0402; Manufacturer: Panasonic; Value_Code: 0000; Power_W: 100mW; Value2: 0.1W; VDC_V: 50V; TempCo: 600 ppm/C; EIA_Code: E24; AEC Category: Q200; AEC Qualified: Y; SizeArea_mm2: 0.5; SizeAreaWB_mm2: 3; SizeX_mm: 1; SizeZ_mm: 0.6; CompType: Resistor; PartNumber: ERJ-2GE0R00X; PackageReference: 0402; RoHS: Y; Res_ohm: 0; Tolerance_%: 5%; Value1: 5%; MountType: SMT; Technology: Thick Film; ComponentLink1Description: Datasheet link; ComponentLink1URL: https://industrial.panasonic.com/cdbs/www-data/pdf/RDA0000/AOA0000C301.pdf; Supplier 1: Digi-Key; Supplier Part Number 1: P0.0JCT-ND; Supplier 2: Newark; Supplier Part Number 2: 65T8307; Supplier 3: Mouser; Supplier Part Number 3: 667-ERJ-2GE0R00X; AEC Grade: 0; SizeY_mm: 0.5; ValueDisplayed: 0
R64-R67 = CMP-0025963-3: RES, 10.0, 1%, 0.063 W, AEC-Q200 Grade 0, 0402; Manufacturer: Vishay-Dale; Power_W: 63mW; TempCo: 100 ppm/C; Value_Code: 10R0; Value: 10.0; EIA_Code: E96; Res_ohm: 10; SizeX_mm: 1; SizeY_mm: 0.5; SizeZ_mm: 0.6; Value2: 0.063W; AEC Qualified: Y; VDC_V: 50V; AEC Category: Q200; AEC Grade: 0; Supplier Part Number 2: 52K6600; Supplier 2: Newark; Supplier Part Number 3: 71-CRCW0402-10-E3; Supplier 3: Mouser; RoHS: E; Value1: 1%; MountType: SMT; Supplier 1: Digi-Key; PackageReference: 0402; Tolerance_%: 1%; SizeArea_mm2: 0.5; CompType: Resistor; PartNumber: CRCW040210R0FKED; ComponentLink1Description: Datasheet link; Supplier Part Number 1: 541-10.0LCT-ND; Technology: Thick Film; ComponentLink1URL: http://www.vishay.com/docs/20035/dcrcwe3.pdf
R68 = CMP-0026992-3: RES, 0, 5%, 0.1 W, AEC-Q200 Grade 0, 0402; Manufacturer: Panasonic; PartNumber: ERJ-2GE0R00X; Value_Code: 0000; Power_W: 100mW; Value2: 0.1W; VDC_V: 50V; TempCo: 600 ppm/C; EIA_Code: E24; AEC Category: Q200; AEC Qualified: Y; SizeArea_mm2: 0.5; SizeAreaWB_mm2: 3; SizeX_mm: 1; SizeZ_mm: 0.6; CompType: Resistor; PackageReference: 0402; RoHS: Y; Res_ohm: 0; Tolerance_%: 5%; Value1: 5%; MountType: SMT; Technology: Thick Film; ComponentLink1Description: Datasheet link; ComponentLink1URL: https://industrial.panasonic.com/cdbs/www-data/pdf/RDA0000/AOA0000C301.pdf; Supplier 1: Digi-Key; Supplier Part Number 1: P0.0JCT-ND; Supplier 2: Newark; Supplier Part Number 2: 65T8307; Supplier 3: Mouser; Supplier Part Number 3: 667-ERJ-2GE0R00X; AEC Grade: 0; SizeY_mm: 0.5; ValueDisplayed: 0
R69 R70 = CMP-0025697-4: RES, 0, 5%, 0.1 W, AEC-Q200 Grade 0, 0603; PartNumber: CRCW06030000Z0EA; Manufacturer: Vishay-Dale; Value_Code: 0000; Power_W: 100mW; Value2: 0.1W; VDC_V: 75V; TempCo: 200 ppm/C; EIA_Code: E24; AEC Category: Q200; AEC Qualified: Y; SizeArea_mm2: 1.28; SizeX_mm: 1.6; SizeY_mm: 0.8; SizeZ_mm: 1; CompType: Resistor; PackageReference: 0603; RoHS: E; Res_ohm: 0; Tolerance_%: 5%; Value1: 5%; MountType: SMT; Technology: Thick Film; ComponentLink1Description: Datasheet link; ComponentLink1URL: http://www.vishay.com/docs/20035/dcrcwe3.pdf; Supplier 1: Digi-Key; Supplier Part Number 1: 541-0.0GCT-ND; Supplier 2: Newark; Supplier Part Number 2: 52K8014; Supplier 3: Mouser; Supplier Part Number 3: 71-CRCW0603-0-E3; ValueDisplayed: 0; AEC Grade: 0
R71-R73 R75 = CMP-0026888-3: RES, 27, 5%, 0.063 W, AEC-Q200 Grade 0, 0402; Manufacturer: Vishay-Dale; Power_W: 63mW; TempCo: 200 ppm/C; Value_Code: 27R0; Value: 27; EIA_Code: E24; SizeX_mm: 1; SizeY_mm: 0.5; SizeZ_mm: 0.6; Value2: 0.063W; AEC Qualified: Y; VDC_V: 50V; AEC Category: Q200; AEC Grade: 0; Supplier Part Number 2: 59M6721; Supplier 2: Newark; Supplier Part Number 3: 71-CRCW0402J-27-E3; Supplier 3: Mouser; RoHS: E; Value1: 5%; MountType: SMT; Supplier 1: Digi-Key; PackageReference: 0402; Tolerance_%: 5%; Res_ohm: 27; SizeArea_mm2: 0.5; CompType: Resistor; PartNumber: CRCW040227R0JNED; ComponentLink1Description: Datasheet link; Supplier Part Number 1: 541-27JCT-ND; Technology: Thick Film; ComponentLink1URL: http://www.vishay.com/docs/20035/dcrcwe3.pdf
R74 = CMP-2002-00429-1: Manufacturer: Panasonic; Part Number: ERJ-2GE0R00X
R76 = CMP-0026085-3: RES, 1.40 k, 1%, 0.063 W, AEC-Q200 Grade 0, 0402; Manufacturer: Vishay-Dale; Power_W: 63mW; TempCo: 100 ppm/C; Value_Code: 1k40; Value: 1.40k; EIA_Code: E96; Res_ohm: 1.4k; SizeX_mm: 1; SizeY_mm: 0.5; SizeZ_mm: 0.6; Value2: 0.063W; AEC Qualified: Y; VDC_V: 50V; AEC Category: Q200; AEC Grade: 0; ComponentLink1URL: http://www.vishay.com/docs/20035/dcrcwe3.pdf; Supplier Part Number 2: 52K6569; Supplier 2: Newark; Supplier Part Number 3: 71-CRCW0402-1.4K-E3; Supplier 3: Mouser; RoHS: E; Value1: 1%; MountType: SMT; Supplier 1: Digi-Key; PackageReference: 0402; Tolerance_%: 1%; SizeArea_mm2: 0.5; CompType: Resistor; PartNumber: CRCW04021K40FKED; ComponentLink1Description: Datasheet link; Supplier Part Number 1: 541-1.40KLCT-ND; Technology: Thick Film
R77 = CMP-0026859-2: RES, 1.0 M, 5%, 0.063 W, AEC-Q200 Grade 0, 0402; Manufacturer: Vishay-Dale; Power_W: 63mW; TempCo: 200 ppm/C; Value_Code: 1M00; Value: 1.0Meg; EIA_Code: E24; Res_ohm: 1M; SizeX_mm: 1; SizeY_mm: 0.5; SizeZ_mm: 0.6; Value2: 0.063W; AEC Qualified: Y; VDC_V: 50V; AEC Category: Q200; AEC Grade: 0; ComponentLink1URL: http://www.vishay.com/docs/20035/dcrcwe3.pdf; Supplier Part Number 2: 59M6694; Supplier 2: Newark; Supplier Part Number 3: 71-CRCW0402J-1M-E3; Supplier 3: Mouser; RoHS: E; Value1: 5%; MountType: SMT; Supplier 1: Digi-Key; PackageReference: 0402; Tolerance_%: 5%; SizeArea_mm2: 0.5; CompType: Resistor; PartNumber: CRCW04021M00JNED; ComponentLink1Description: Datasheet link; Supplier Part Number 1: 541-1.0MJCT-ND; Technology: Thick Film
R78 = CMP-0026907-3: RES, 33 k, 5%, 0.063 W, AEC-Q200 Grade 0, 0402; Manufacturer: Vishay-Dale; Power_W: 63mW; TempCo: 200 ppm/C; Value_Code: 33k0; Value: 33k; EIA_Code: E24; SizeX_mm: 1; SizeY_mm: 0.5; SizeZ_mm: 0.6; Value2: 0.063W; AEC Qualified: Y; VDC_V: 50V; AEC Category: Q200; AEC Grade: 0; ComponentLink1URL: http://www.vishay.com/docs/20035/dcrcwe3.pdf; Supplier Part Number 2: 59M6727; Supplier 2: Newark; Supplier Part Number 3: 71-CRCW0402J-33K-E3; Supplier 3: Mouser; RoHS: E; Value1: 5%; MountType: SMT; Supplier 1: Digi-Key; PackageReference: 0402; Tolerance_%: 5%; Res_ohm: 33k; SizeArea_mm2: 0.5; CompType: Resistor; PartNumber: CRCW040233K0JNED; ComponentLink1Description: Datasheet link; Supplier Part Number 1: 541-33KJCT-ND; Technology: Thick Film
SH-J23-SH-J29 = CMP-0003761-2: as SH-J18 on sheet MD041_Motor_Driver_RevA; ComponentLink1URL: http://katalog.we-online.de/em/datasheet/60900213421.pdf; Supplier Part Number 2: 16T0609; Supplier 3: Mouser; Supplier 1: Digi-Key; CompType: Shunt; PackageReference: Shunt, 2.54mm, Black; RoHS: Y; Supplier Part Number 1: 732-2678-ND; Supplier Part Number 3: 710-60900213421; Supplier 2: Newark; MountType: N/A; PartNumber: 60900213421; ComponentLink1Description: Datasheet Link; ClassName: Shunt
U2 = CMP-0039269-4: 16-Bit Ultra-Low-Power Microcontroller, 128KB Flash, 8KB RAM, USB, 12Bit ADC, 2 USCIs, 32Bit HW MPY, RGC0064B (VQFN-64); Alternate Manufacturer: Texas Instruments; Alternate PartNumber: MSP430F5528IRGCR; ADC: 12-bit SAR; ADC Channels: 16; Brown Out Reset: Yes; DMA: 3; Flash(KB): 128; Frequency(MHz): 25; GPIO: 47; Multiplier: 32x32; SRAM(B): 8192; Timers - 16-bit: 4; USB: 1; USCI_A (UART/LIN/IrDA/SPI): 2; Rating: Catalog; SizeArea_mm2: 81.0; SizeZ_mm: 1.0; Green_REACh: Passed; AEC Qualified: N; AEC Category: Q200; CompType: IC; Green_Lifecycle: Active; SizeY_mm: 9.0; SizeAreaWB_mm2: 121.0; PackageReference: RGC0064B; PackageDescription: VQFN-64; Comparators: Yes; Real-Time Clock: Yes; SVS: Yes; Temp Sensor: Yes; USCI_B (I2C & SPI): 2; Watchdog: Yes; MountType: SMT; ComponentLink1Description: Datasheet Link; ComponentLink1URL: http://www.ti.com/lit/ds/symlink/msp430f5528.pdf; ComponentLink2Description: Product Folder; ComponentLink2URL: http://www.ti.com/product/msp430f5528; PartNumber: MSP430F5528IRGCT; Manufacturer: Texas Instruments; Operating Temperature Range: -40 to 85 C; Green_EU RoHS-2: Passed; Green_EU RoHS: Passed; RoHS: Y; ComponentLink3URL: http://www.ti.com/product/msp430f5528/datasheet; ComponentLink3Description: Online Datasheet; SizeX_mm: 9.0
U3 = CMP-0036328-3: 500mA, Adjustable, Low Quiescent Current, Low-Noise, High-PSRR, Single-Output LDO Regulator, DRB0008A (VSON-8); Manufacturer: Texas Instruments; CompType: IC; Green_Lifecycle: Active; SizeZ_mm: 1.0; Iq(Typ)(mA): 0.04; SizeY_mm: 3.0; SizeAreaWB_mm2: 16.0; SizeArea_mm2: 9.0; AEC Category: Q200; Vout Adj(Max)(V): 3.3; AEC Qualified: N; Accuracy(%): 2; Vin(Max)(V): 6.5; Vdo(Typ)(mV): 280; Iout(Max)(A): 0.5; Green_REACh: Passed; Rating: Catalog; Vin(Min)(V): 2.7; RoHS: Y; ComponentLink3URL: http://www.ti.com/product/tps735/datasheet; PackageDescription: VSON-8; ComponentLink3Description: Online Datasheet; Green_EU RoHS: Passed; MountType: SMT; ComponentLink1URL: http://www.ti.com/lit/ds/symlink/tps735.pdf; Green_EU RoHS-2: Passed; ComponentLink2Description: Product Folder; PartNumber: TPS73533DRBR; ComponentLink2URL: http://www.ti.com/product/tps735; PackageReference: DRB0008A; SizeX_mm: 3.0; ComponentLink1Description: Datasheet Link; Fixed Output Options(V): 3.3; Operating Temperature Range: -40 to 125 C; Vout Adj(Min)(V): 3.3
U4 = CMP-0004774-1: USB to Serial UART, SSOP28; Manufacturer: FTDI; ComponentLink1URL: http://www.ftdichip.com/Support/Documents/DataSheets/ICs/DS_FT232R.pdf; Publisher: Texas Instruments; Supplier Part Number 2: 91K9918; Supplier 3: Mouser; Supplier 1: Digi-Key; PackageReference: SSOP28; LatestRevisionDate: 09/03/2017; RoHS: Y; Supplier Part Number 1: 768-1007-1-ND; Supplier Part Number 3: 895-FT232RL; Supplier 2: Newark; MountType: SMT; PartNumber: FT232RL; ComponentLink1Description: Datasheet URL
U5 = CMP-0090815-1: LDO, Fixed Output, Dual, 3.3V, 10/12/15V, 50mA, Precision Enable, Power-Good, HVSSOP10; Manufacturer: Texas Instruments; Output Type: Fixed,Multi; Max Supply Voltage: 85V; TJmax_C: +125°C; Output Voltage: 3.3/10/12/15V; SizeZ_mm: 1.1mm; Dropout Voltage: 200/800mV; Min Supply Voltage: 4V; Standoff Height: 0.05mm; AEC Qualified: No; Number Of Outputs: 2; Accuracy Percentage: 1%; Nominal Supply Current: 100uA; Operating Temperature Range: -40°C to +125°C; PackageReference: HVSSOP10; Datasheet Path: datasheets/IC-TPS7A4333DGQ.pdf; RoHS: UNKNOWN; Part Number: TPS7A4333DGQ; helpURL: https://upverter.com/upn/revision/84571c77b8b37202/; PartNumber: TPS7A4333DGQ
U6 = CMP-0043099-3: Low-Capacitance 2-Channel +/-15kV ESD Protection Array for High-Speed Data Interfaces, DRY0006A (USON-6); Manufacturer: Texas Instruments; IO Leakage Current(nA): 1; IEC 61000-4-2 Air-Gap(+/- kV): 15; USB High Speed: TRUE; IO Capacitance(Typ)(pF): 1.5; Eco-Plan: Green (RoHS & no Sb/Br); Breakdown Voltage(Min)(V): 11; IEC 61000-4-2 Contact(+/- kV): 8; AEC Category: Q200; AEC Qualified: N; CompType: IC; SizeAreaWB_mm2: 4.9; SizeArea_mm2: 1.45; SizeX_mm: 1.0; SizeZ_mm: 0.6; Rating: Catalog; ComponentLink1URL: http://www.ti.com/lit/ds/symlink/tpd2e001.pdf; ComponentLink2Description: Product Folder; PackageReference: DRY0006A; ComponentLink3Description: Online Datasheet; PartNumber: TPD2E001DRYR; ComponentLink2URL: http://www.ti.com/product/tpd2e001; PackageDescription: USON-6; ComponentLink3URL: http://www.ti.com/product/tpd2e001/datasheet; ComponentLink1Description: Datasheet Link; MountType: SMT; RoHS: Y; SizeY_mm: 1.45; Operating Temperature Range: -40 to 85 C
Y1 = CMP-0085483-1: Oscillator, 4 MHz, 700 ppm, 39 pF, SMD; Manufacturer: MuRata; SizeArea_mm2: 9; Load Capacitance: 39 pF; SizeZ_mm: 1.2; AEC Category: Q200; Frequency Tolerance: 700 ppm; SizeX_mm: 4.5; SizeAreaWB_mm2: 16.5; TaMax_C: 85°C; TaMin_C: -20°C; SizeY_mm: 2; AEC Qualified: N; Frequency_Fixed: 4MHz; CompType: Oscillator; ComponentLink1URL: https://www.murata.com/en-us/products/productdata/8802049818654/SPEC-CSTNR6M00GH5L000R0.pdf?1528293605000; RoHS: Y; MountType: SMT; PackageReference: 4.5x2mm; ComponentLink1Description: Datasheet Link; AEC Grade: N/A; PartNumber: CSTNR4M00GH5L000R0